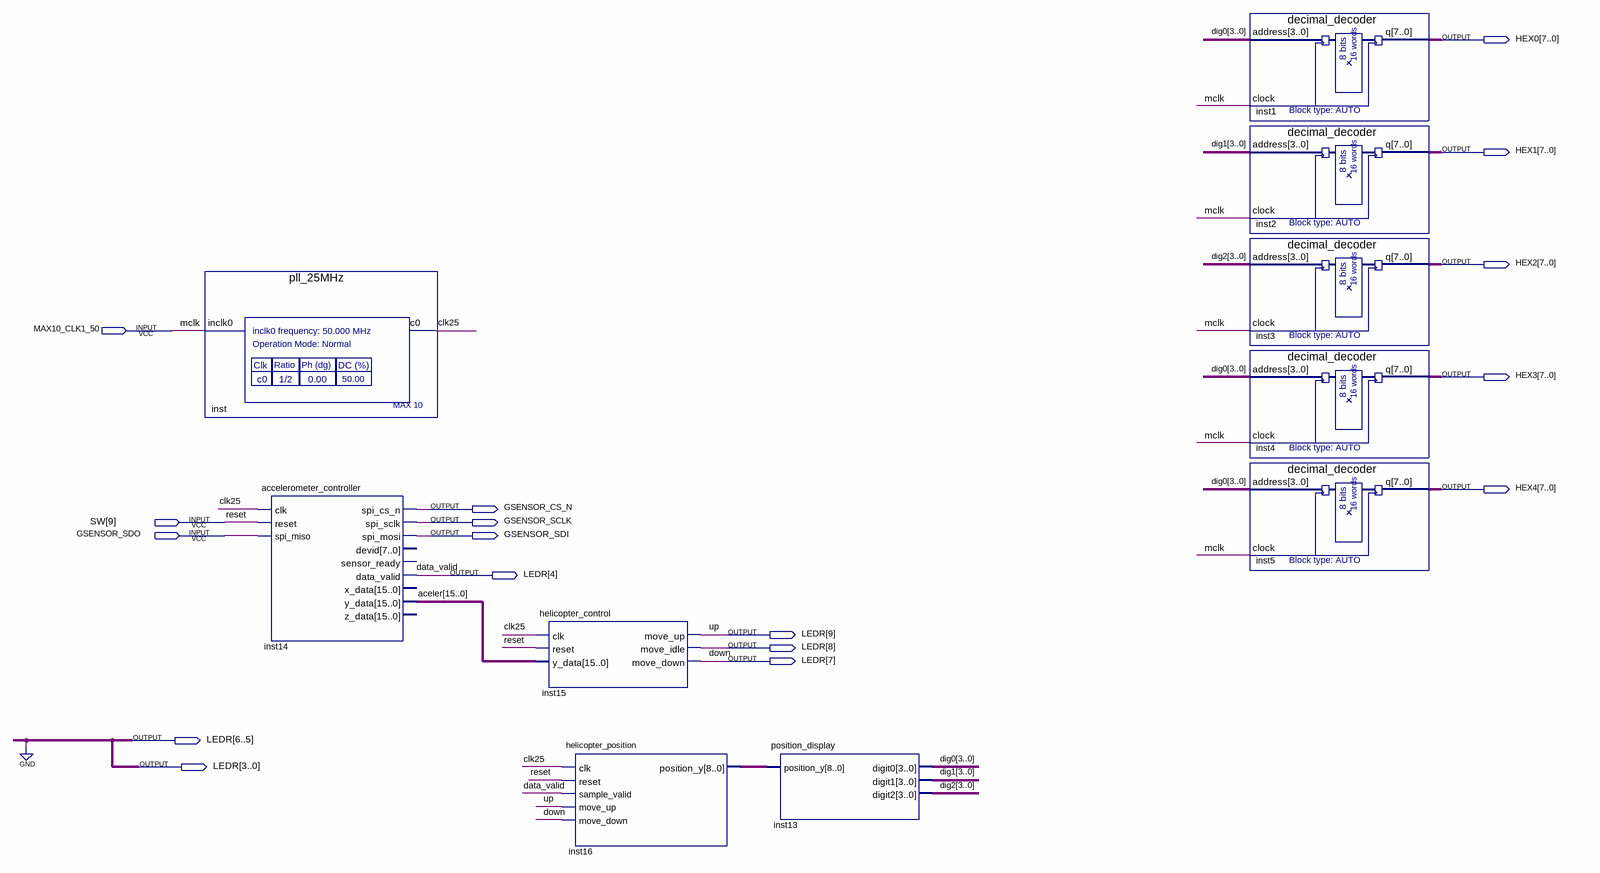
[diagram p0: schematic sheet]
// Quartus schematic helicopter_escape.bdf as structural Verilog: 10 symbols, 17 pins
module helicopter_escape (
  input  MAX10_CLK1_50,
  input  [9:9] SW,
  input  GSENSOR_SDO,
  output [7:0] HEX0,
  output [7:0] HEX1,
  output [7:0] HEX2,
  output [7:0] HEX3,
  output [7:0] HEX4,
  output GSENSOR_CS_N,
  output GSENSOR_SCLK,
  output GSENSOR_SDI,
  output [9:0] LEDR
);

  wire clk25;
  wire [3:0] dig0, dig1, dig2;
  wire [8:0] inst16_position_y;
  wire [15:0] aceler;

  pll_25MHz inst (.inclk0(MAX10_CLK1_50), .c0(clk25));
  accelerometer_controller inst14 (
    .clk(clk25), .reset(SW[9]), .spi_miso(GSENSOR_SDO), .spi_cs_n(GSENSOR_CS_N), .spi_sclk(GSENSOR_SCLK),
    .spi_mosi(GSENSOR_SDI), .data_valid(LEDR[4]), .y_data(aceler));  // open: devid, sensor_ready, x_data, z_data
  helicopter_control inst15 (
    .clk(clk25), .reset(SW[9]), .y_data(aceler), .move_up(LEDR[9]), .move_idle(LEDR[8]), .move_down(LEDR[7]));
  helicopter_position inst16 (
    .clk(clk25), .reset(SW[9]), .sample_valid(LEDR[4]), .move_up(LEDR[9]), .move_down(LEDR[7]),
    .position_y(inst16_position_y));
  position_display inst13 (.position_y(inst16_position_y), .digit0(dig0), .digit1(dig1), .digit2(dig2));
  decimal_decoder inst1 (.address(dig0), .clock(MAX10_CLK1_50), .q(HEX0));
  decimal_decoder inst2 (.address(dig1), .clock(MAX10_CLK1_50), .q(HEX1));
  decimal_decoder inst3 (.address(dig2), .clock(MAX10_CLK1_50), .q(HEX2));
  decimal_decoder inst4 (.address(dig0), .clock(MAX10_CLK1_50), .q(HEX3));
  decimal_decoder inst5 (.address(dig0), .clock(MAX10_CLK1_50), .q(HEX4));

  // Other names for the same wires on the sheet: data_valid = LEDR[4]; down = LEDR[7]; mclk = MAX10_CLK1_50;
  //   reset = SW[9]; up = LEDR[9]
endmodule
